# Altium project Main_Board.PrjPcb (part 31 of 44)

## Sheet ST1L08_5V_0V6.SchDoc
size A3
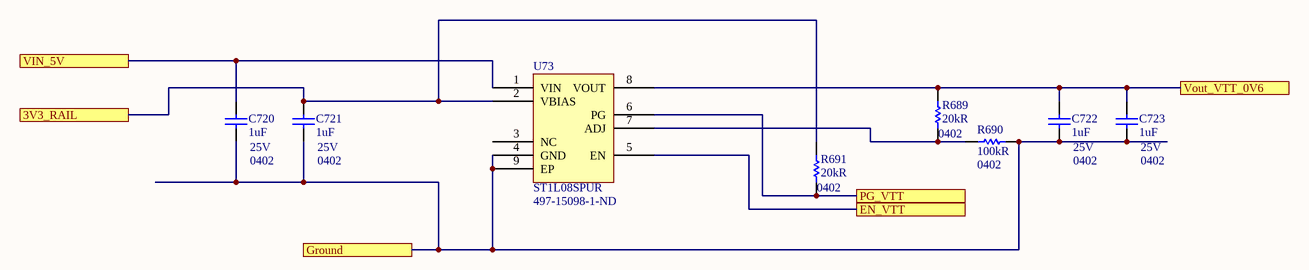
[diagram p44: ST1L08_5V_0V6.SchDoc]

### Parts
C720  1uF  Case/Package: 0402  Voltage Rating: 25V  [CAP 0402/1005 KK]
C721  1uF  Case/Package: 0402  Voltage Rating: 25V  [CAP 0402/1005 KK]
C722  1uF  Case/Package: 0402  Voltage Rating: 25V  [CAP 0402/1005 KK]
C723  1uF  Case/Package: 0402  Voltage Rating: 25V  [CAP 0402/1005 KK]
R689  20kR  Case/Package: 0402  [RES 0402/1005 RF KK]
R690  100kR  Case/Package: 0402  [RES 0402/1005 RF KK]
R691  20kR  Case/Package: 0402  [RES 0402/1005 RF KK]
U73  ST1L08SPUR  Supplier Part Number 1: 497-15098-1-ND  [ST1L08]

### Ports
3V3_RAIL, EN_VTT, Ground, PG_VTT, VIN_5V, Vout_VTT_0V6

### Nets
B503_Ground: C720.1 C721.1 C722.1 C723.1 R690.1 U73.4(GND) U73.9(EP) ; port Ground
3V3_RAIL: C721.2 R691.1 U73.2(VBIAS) ; port 3V3_RAIL
5V_RAIL: C720.2 U73.1(VIN) ; port VIN_5V
GPIOb_02.GPIO4: R691.2 U73.6(PG) ; port PG_VTT
PG2_TPS7A8801_0V9: U73.5(EN) ; port EN_VTT
RAM_DDR4_VTT: C722.2 C723.2 R689.1 U73.8(VOUT) ; port Vout_VTT_0V6
NetR689_2: R689.2 R690.2 U73.7(ADJ)

Not connected (* = marked no-connect by the designer): U73 3(NC)

### Notes on the sheet
- Title
- Size:
- Date:
- A3
- Number:
- Time:
- Revision:
- Sheet
- of
- File:

### Library data of the parts
C720-C723 = Capacitor: as C597 on sheet Power_48_20V@3A; Supplier 1: Digi-Key; Supplier Part Number 1: 490-12263-1-ND; Manufacturer: Murata; Manufacturer Part Number: GRT155R61E105KE01D; RoHS: Yes; Category: Ceramic Capacitors; Stock 1: 341453; Pricing 1: 1=0,18000, 10=0,12300, 100=0,06210, 500=0,04248, 1000=0,03758, 2500=0,03594, 5000=0,03268 (USD); Mount: Surface Mount; Case Code (Metric): 1005; Case Code (Imperial): 0402; Min Operating Temperature: -55°C; Max Operating Temperature: 85°C; Packaging: Tape and Reel; Capacitance: 1uF; Tolerance: 10%; Dielectric: X5R; Voltage Rating (DC): 25V; Length: 0.039inch; Width: 0.02inch; Thickness: 0.022inch; Ratings: AEC-Q200; ComponentLink1URL: http://www.farnell.com/datasheets/2165918.pdf?src-supplier=Farnell; ComponentLink1Description: http://www.farnell.com/datasheets/2165918.pdf?src-supplier=Farnell; ComponentLink2URL: http://search.murata.co.jp/Ceramy/image/img/A01X/G101/ENG/GRT155R61E105KE01-01.pdf?src-supplier=Digi-Key; ComponentLink2Description: http://search.murata.co.jp/Ceramy/image/img/A01X/G101/ENG/GRT155R61E105KE01-01.pdf?src-supplier=Digi-Key; ComponentLink3URL: http://www.farnell.com/datasheets/2165918.pdf?src-supplier=Element14; ComponentLink3Description: http://www.farnell.com/datasheets/2165918.pdf?src-supplier=Element14
R689 R691 = Resistor: as R676 on sheet TPS7A88_3V3_1V8_0V9V@2x1A; Supplier 1: Digi-Key; Supplier Part Number 1: P20.0KLCT-ND; Stock 1: 2516725; Pricing 1: 1 = 0,10000, 10 = 0,05000, 100 = 0,02050, 1000 = 0,00920, 2500 = 0,00798, 5000 = 0,00660 (USD); RoHS: Yes; Mount: Surface Mount; Weight: 2.8E-05oz; Case Code (Metric): 1005; Case Code (Imperial): 0402; Contact Plating: Tin; Min Operating Temperature: -55°C; Max Operating Temperature: 155°C; Resistance: 20kR; Packaging: Cut Tape; Package Quantity: 1; Composition: Thick Film; Number of Terminations: 2; Termination: SMD/SMT; Military Standard: Not; Max Power Dissipation: 100mW; Voltage Rating (DC): 50V; Features: Automotive AEC-Q200; Length: 1mm; Height: 0.35mm; Width: 0.02inch; Depth: 0.5mm; Radiation Hardening: No; REACH SVHC: No SVHC; Lead Free: Lead Free; ComponentLink1URL: https://datasheet.ciiva.com/11821/0900766b80f80784-11821220.pdf?src-supplier=RSComponents; ComponentLink1Description: https://datasheet.ciiva.com/11821/0900766b80f80784-11821220.pdf?src-supplier=RSComponents; ComponentLink2URL: https://datasheet.ciiva.com/16762/70260748-16762885.pdf?src-supplier=Allied+Electronics; ComponentLink2Description: https://datasheet.ciiva.com/16762/70260748-16762885.pdf?src-supplier=Allied+Electronics; ComponentLink3URL: https://datasheet.ciiva.com/16782/70260748-16782455.pdf?src-supplier=Allied+Electronics; ComponentLink3Description: https://datasheet.ciiva.com/16782/70260748-16782455.pdf?src-supplier=Allied+Electronics; ComponentLink4URL: https://datasheet.ciiva.com/48531/aoa0000ce2-48531063.pdf?src-supplier=Avnet; ComponentLink4Description: https://datasheet.ciiva.com/48531/aoa0000ce2-48531063.pdf?src-supplier=Avnet; ComponentLink5URL: https://datasheet.ciiva.com/28688/1678782-28688600.pdf?src-supplier=Element14; ComponentLink5Description: https://datasheet.ciiva.com/28688/1678782-28688600.pdf?src-supplier=Element14; ComponentLink6URL: https://datasheet.ciiva.com/46377/426256-46377368.pdf?src-supplier=Element14; ComponentLink6Description: https://datasheet.ciiva.com/46377/426256-46377368.pdf?src-supplier=Element14; ComponentLink7URL: https://datasheet.ciiva.com/6138/426256-6138761.pdf?src-supplier=Farnell; ComponentLink7Description: https://datasheet.ciiva.com/6138/426256-6138761.pdf?src-supplier=Farnell; ComponentLink8URL: https://datasheet.ciiva.com/24159/aoa0000ce2-24159274.pdf?src-supplier=Mouser; ComponentLink8Description: https://datasheet.ciiva.com/24159/aoa0000ce2-24159274.pdf?src-supplier=Mouser; ComponentLink9URL: https://datasheet.ciiva.com/16508/aoa0000ce2-16508524.pdf?src-supplier=Future+Electronics; ComponentLink9Description: https://datasheet.ciiva.com/16508/aoa0000ce2-16508524.pdf?src-supplier=Future+Electronics; ComponentLink10URL: https://datasheet.ciiva.com/16514/aoa0000ce2-16514269.pdf?src-supplier=Avnet+Asia; ComponentLink10Description: https://datasheet.ciiva.com/16514/aoa0000ce2-16514269.pdf?src-supplier=Avnet+Asia; ComponentLink11URL: https://datasheet.ciiva.com/30049/aoa0000ce2-30049982.pdf?src-supplier=Onlinecomponents.com; ComponentLink11Description: https://datasheet.ciiva.com/30049/aoa0000ce2-30049982.pdf?src-supplier=Onlinecomponents.com
R690 = Resistor: as R646 on sheet ADP1741_3V3_0V85; Supplier 1: Digi-Key; Supplier Part Number 1: P100KDECT-ND; Stock 1: 54338; Pricing 1: 1=0.22000, 10=0.18800, 100=0.07350, 1000=0.03077, 2500=0.02820, 5000=0.02564 (USD); RoHS: Yes; Mount: Surface Mount; Case Code (Imperial): 0402; Case Code (Metric): 1005; Contact Plating: Tin; Min Operating Temperature: -55°C; Max Operating Temperature: 155°C; Resistance: 100kR; Packaging: Tape and Reel; Package Quantity: 10000; Composition: Metal Film,Thin Film; Number of Terminations: 2; Military Standard: Not; Termination: SMD/SMT; Max Power Dissipation: 63mW; Voltage Rating (DC): 25V; Length: 1mm; Height: 0.016inch; Width: 0.5mm; Depth: 0.5mm; Radiation Hardening: No; REACH SVHC: No SVHC; Lead Free: Lead Free; ComponentLink1URL: https://datasheet.ciiva.com/24028/aoa0000ce26-197354-24028150.pdf?src-supplier=Mouser; ComponentLink1Description: https://datasheet.ciiva.com/24028/aoa0000ce26-197354-24028150.pdf?src-supplier=Mouser; ComponentLink2URL: https://datasheet.ciiva.com/43470/1776116-43470438.pdf?src-supplier=Farnell; ComponentLink2Description: https://datasheet.ciiva.com/43470/1776116-43470438.pdf?src-supplier=Farnell; ComponentLink3URL: https://datasheet.ciiva.com/7830/1776116-7830920.pdf?src-supplier=Element14; ComponentLink3Description: https://datasheet.ciiva.com/7830/1776116-7830920.pdf?src-supplier=Element14; ComponentLink4URL: https://datasheet.ciiva.com/46378/1776116-46378234.pdf?src-supplier=Element14; ComponentLink4Description: https://datasheet.ciiva.com/46378/1776116-46378234.pdf?src-supplier=Element14; ComponentLink5URL: https://datasheet.ciiva.com/16780/70068849-16780139.pdf?src-supplier=Allied+Electronics; ComponentLink5Description: https://datasheet.ciiva.com/16780/70068849-16780139.pdf?src-supplier=Allied+Electronics; ComponentLink6URL: https://datasheet.ciiva.com/9117/aoa0000ce26-9117229.pdf?src-supplier=Avnet; ComponentLink6Description: https://datasheet.ciiva.com/9117/aoa0000ce26-9117229.pdf?src-supplier=Avnet; ComponentLink7URL: https://datasheet.ciiva.com/16511/aoa0000ce26-16511566.pdf?src-supplier=Avnet+Asia; ComponentLink7Description: https://datasheet.ciiva.com/16511/aoa0000ce26-16511566.pdf?src-supplier=Avnet+Asia; ComponentLink8URL: https://datasheet.ciiva.com/30225/54aoa0000ce26-30225311.pdf?src-supplier=Onlinecomponents.com; ComponentLink8Description: https://datasheet.ciiva.com/30225/54aoa0000ce26-30225311.pdf?src-supplier=Onlinecomponents.com
U73 = ST1L08SPUR: IC REG LINEAR POS ADJ 800MA 8DFN; Manufacturer: STMicroelectronics; Number of Outputs: 1; Min Input Voltage: 1V; Max Input Voltage: 5.5V; Output Voltage: 4V; Dropout Voltage: 700mV; Polarity: Positive; Accuracy: 2%; Quiescent Current: 150uA; Operating Supply Current: 200nA; Power Supply Rejection Ratio (PSRR): 80dB; Output Type: Adjustable; Supplier 1: Digi-Key; Manufacturer Part Number: ST1L08SPUR; Stock 1: 4850; Pricing 1: 1 = 0,72000, 10 = 0,63200, 25 = 0,59400, 100 = 0,45020, 250 = 0,38316, 500 = 0,36400, 1000 = 0,27779 (USD); RoHS: Yes; Mount: Surface Mount; Case/Package: DFN; Number of Pins: 8; Min Operating Temperature: -40°C; Max Operating Temperature: 125°C; Packaging: Tape and Reel; Max Output Current: 800mA; Output Current: 800mA; Number of Regulators: 1; Input Bias Current: 150uA; Package Quantity: 2500; Tolerance: 2%; Length: 2mm; Height: 0.9mm; Width: 3mm; Radiation Hardening: No; Lead Free: Lead Free; ComponentLink1URL: https://datasheet.ciiva.com/48677/dm00123507-48677501.pdf?src-supplier=Avnet; ComponentLink1Description: https://datasheet.ciiva.com/48677/dm00123507-48677501.pdf?src-supplier=Avnet

## Sheet Power_LED.SchDoc: Power_Led
size A3
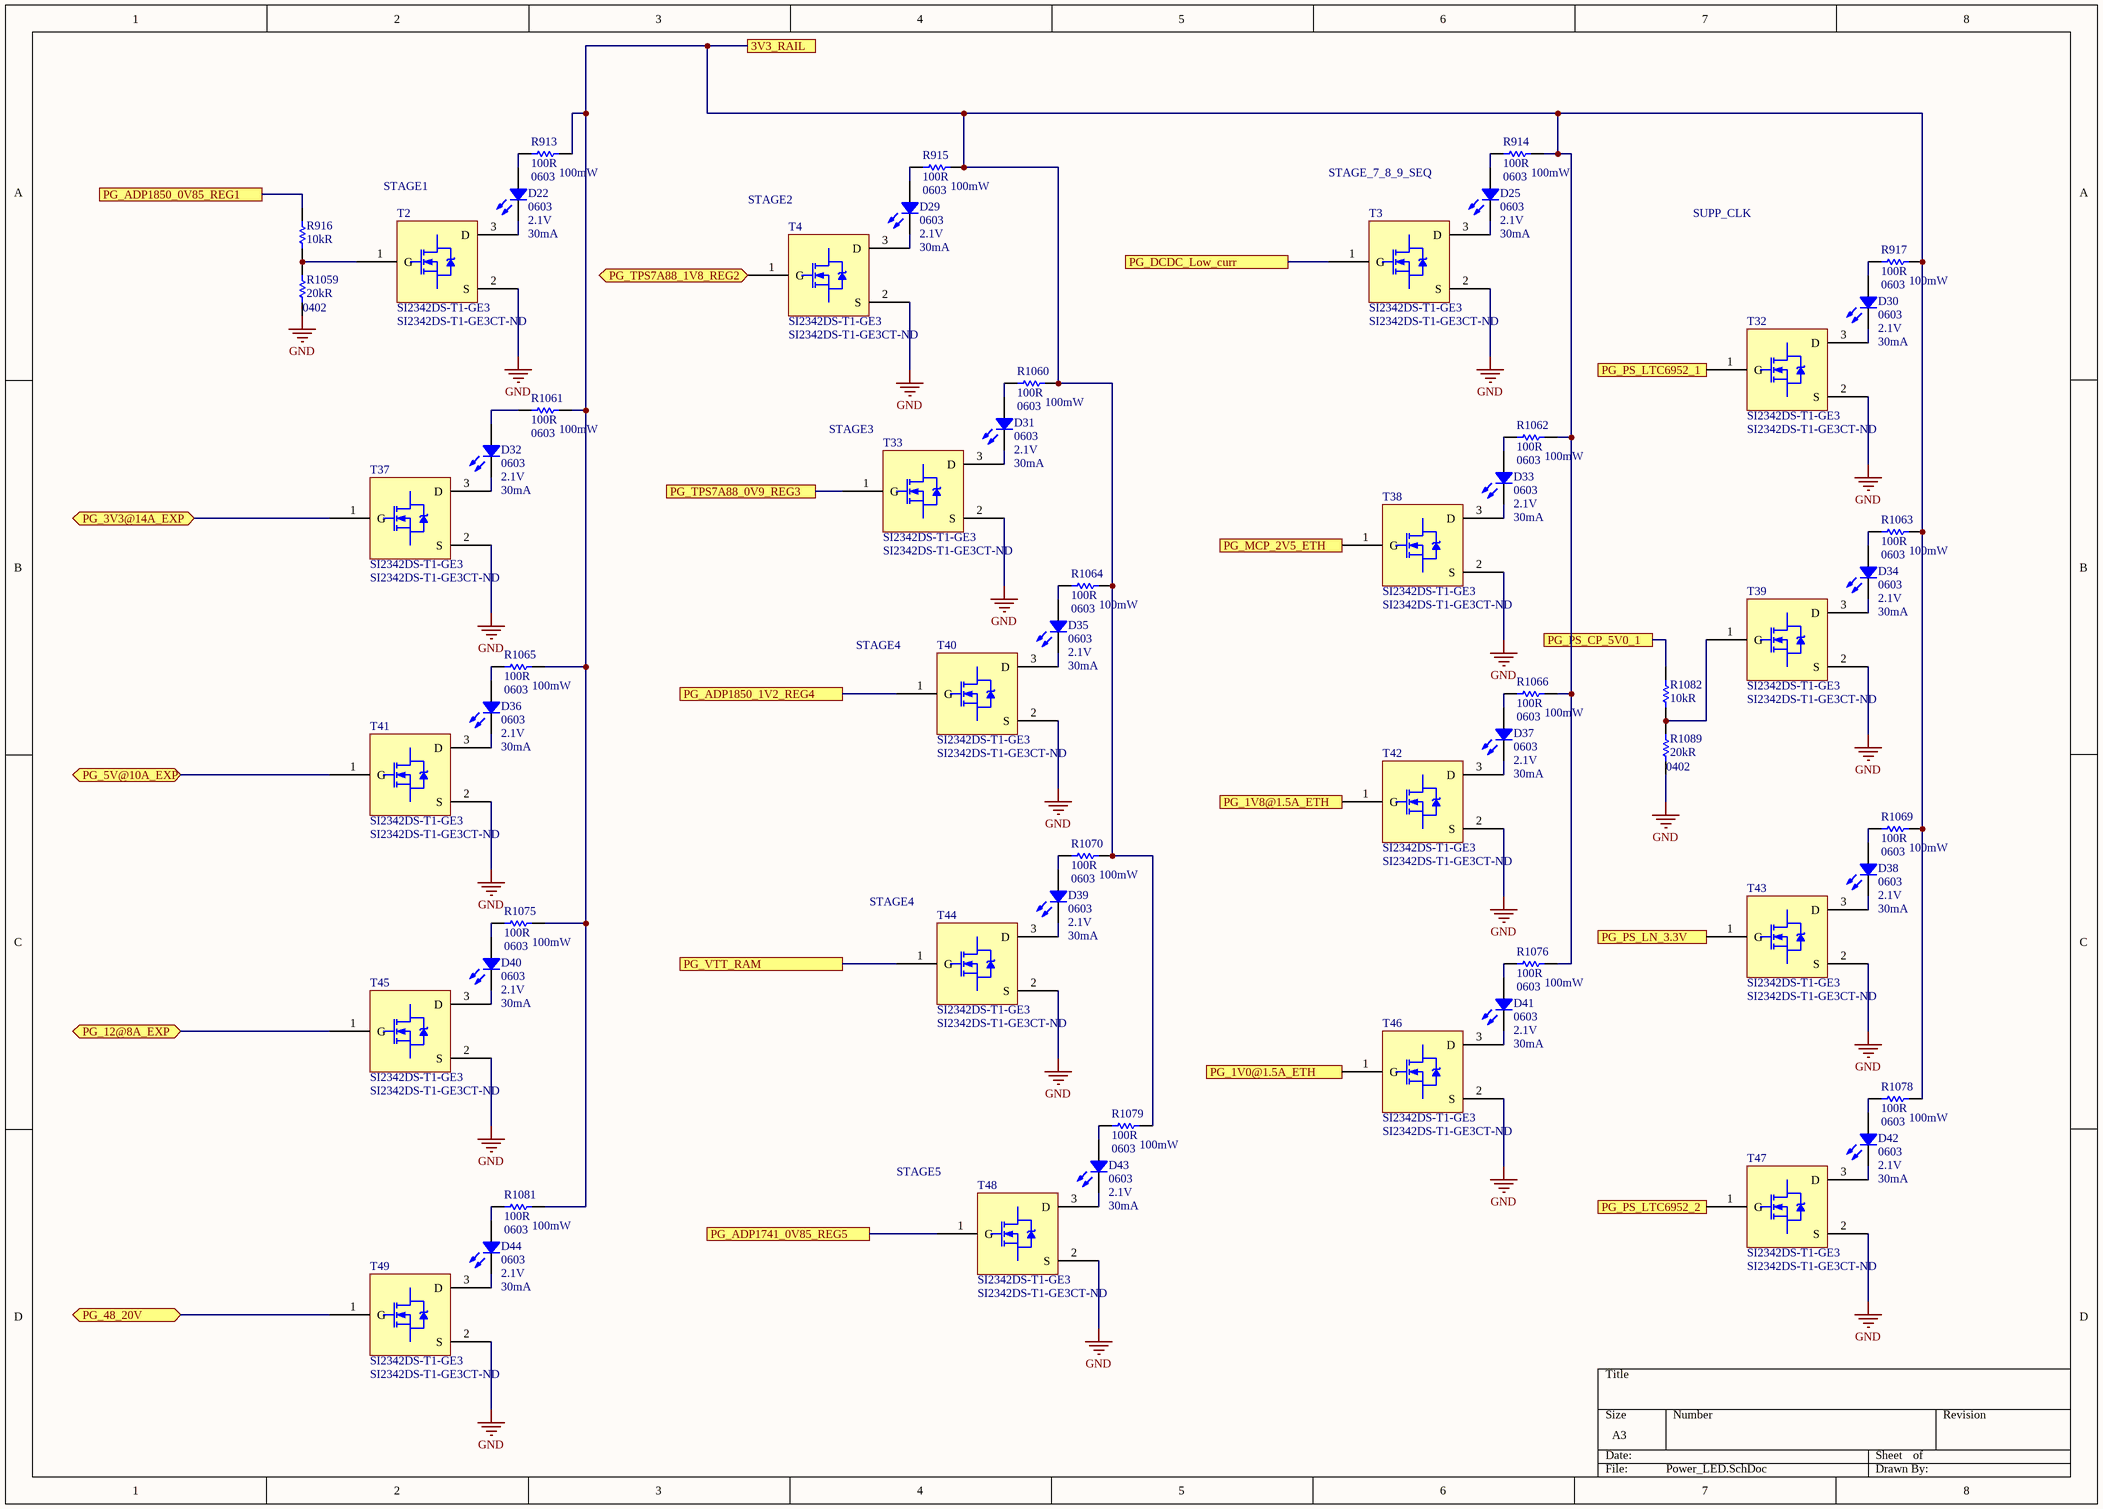
[diagram p45: Power_LED.SchDoc]

### Parts
D22  Case Code (Imperial): 0603  Forward Voltage: 2.1V  Forward Current: 30mA  [LED 0603/1608 GREEN]  (hidden comment: LTST-C190GKT)
D25  Case Code (Imperial): 0603  Forward Voltage: 2.1V  Forward Current: 30mA  [LED 0603/1608 GREEN]  (hidden comment: LTST-C190GKT)
D29  Case Code (Imperial): 0603  Forward Voltage: 2.1V  Forward Current: 30mA  [LED 0603/1608 GREEN]  (hidden comment: LTST-C190GKT)
D30  Case Code (Imperial): 0603  Forward Voltage: 2.1V  Forward Current: 30mA  [LED 0603/1608 GREEN]  (hidden comment: LTST-C190GKT)
D31  Case Code (Imperial): 0603  Forward Voltage: 2.1V  Forward Current: 30mA  [LED 0603/1608 GREEN]  (hidden comment: LTST-C190GKT)
D32  Case Code (Imperial): 0603  Forward Voltage: 2.1V  Forward Current: 30mA  [LED 0603/1608 GREEN]  (hidden comment: LTST-C190GKT)
D33  Case Code (Imperial): 0603  Forward Voltage: 2.1V  Forward Current: 30mA  [LED 0603/1608 GREEN]  (hidden comment: LTST-C190GKT)
D34  Case Code (Imperial): 0603  Forward Voltage: 2.1V  Forward Current: 30mA  [LED 0603/1608 GREEN]  (hidden comment: LTST-C190GKT)
D35  Case Code (Imperial): 0603  Forward Voltage: 2.1V  Forward Current: 30mA  [LED 0603/1608 GREEN]  (hidden comment: LTST-C190GKT)
D36  Case Code (Imperial): 0603  Forward Voltage: 2.1V  Forward Current: 30mA  [LED 0603/1608 GREEN]  (hidden comment: LTST-C190GKT)
D37  Case Code (Imperial): 0603  Forward Voltage: 2.1V  Forward Current: 30mA  [LED 0603/1608 GREEN]  (hidden comment: LTST-C190GKT)
D38  Case Code (Imperial): 0603  Forward Voltage: 2.1V  Forward Current: 30mA  [LED 0603/1608 GREEN]  (hidden comment: LTST-C190GKT)
D39  Case Code (Imperial): 0603  Forward Voltage: 2.1V  Forward Current: 30mA  [LED 0603/1608 GREEN]  (hidden comment: LTST-C190GKT)
D40  Case Code (Imperial): 0603  Forward Voltage: 2.1V  Forward Current: 30mA  [LED 0603/1608 GREEN]  (hidden comment: LTST-C190GKT)
D41  Case Code (Imperial): 0603  Forward Voltage: 2.1V  Forward Current: 30mA  [LED 0603/1608 GREEN]  (hidden comment: LTST-C190GKT)
D42  Case Code (Imperial): 0603  Forward Voltage: 2.1V  Forward Current: 30mA  [LED 0603/1608 GREEN]  (hidden comment: LTST-C190GKT)
D43  Case Code (Imperial): 0603  Forward Voltage: 2.1V  Forward Current: 30mA  [LED 0603/1608 GREEN]  (hidden comment: LTST-C190GKT)
D44  Case Code (Imperial): 0603  Forward Voltage: 2.1V  Forward Current: 30mA  [LED 0603/1608 GREEN]  (hidden comment: LTST-C190GKT)
R913  100R  Case/Package: 0603  Power Rating: 100mW  [RES 0603/1608 RF]
R914  100R  Case/Package: 0603  Power Rating: 100mW  [RES 0603/1608 RF]
R915  100R  Case/Package: 0603  Power Rating: 100mW  [RES 0603/1608 RF]
R916  10kR  [RES 0402/1005 RF KK]
R917  100R  Case/Package: 0603  Power Rating: 100mW  [RES 0603/1608 RF]
R1059  20kR  Case/Package: 0402  [RES 0402/1005 RF KK]
R1060  100R  Case/Package: 0603  Power Rating: 100mW  [RES 0603/1608 RF]
R1061  100R  Case/Package: 0603  Power Rating: 100mW  [RES 0603/1608 RF]
R1062  100R  Case/Package: 0603  Power Rating: 100mW  [RES 0603/1608 RF]
R1063  100R  Case/Package: 0603  Power Rating: 100mW  [RES 0603/1608 RF]
R1064  100R  Case/Package: 0603  Power Rating: 100mW  [RES 0603/1608 RF]
R1065  100R  Case/Package: 0603  Power Rating: 100mW  [RES 0603/1608 RF]
R1066  100R  Case/Package: 0603  Power Rating: 100mW  [RES 0603/1608 RF]
R1069  100R  Case/Package: 0603  Power Rating: 100mW  [RES 0603/1608 RF]
R1070  100R  Case/Package: 0603  Power Rating: 100mW  [RES 0603/1608 RF]
R1075  100R  Case/Package: 0603  Power Rating: 100mW  [RES 0603/1608 RF]
R1076  100R  Case/Package: 0603  Power Rating: 100mW  [RES 0603/1608 RF]
R1078  100R  Case/Package: 0603  Power Rating: 100mW  [RES 0603/1608 RF]
R1079  100R  Case/Package: 0603  Power Rating: 100mW  [RES 0603/1608 RF]
R1081  100R  Case/Package: 0603  Power Rating: 100mW  [RES 0603/1608 RF]
R1082  10kR  [RES 0402/1005 RF KK]
R1089  20kR  Case/Package: 0402  [RES 0402/1005 RF KK]
T2  SI2342DS-T1-GE3  Supplier Part Number 1: SI2342DS-T1-GE3CT-ND  [SI2342DS-T1-GE3]
T3  SI2342DS-T1-GE3  Supplier Part Number 1: SI2342DS-T1-GE3CT-ND  [SI2342DS-T1-GE3]
T4  SI2342DS-T1-GE3  Supplier Part Number 1: SI2342DS-T1-GE3CT-ND  [SI2342DS-T1-GE3]
T32  SI2342DS-T1-GE3  Supplier Part Number 1: SI2342DS-T1-GE3CT-ND  [SI2342DS-T1-GE3]
T33  SI2342DS-T1-GE3  Supplier Part Number 1: SI2342DS-T1-GE3CT-ND  [SI2342DS-T1-GE3]
T37  SI2342DS-T1-GE3  Supplier Part Number 1: SI2342DS-T1-GE3CT-ND  [SI2342DS-T1-GE3]
T38  SI2342DS-T1-GE3  Supplier Part Number 1: SI2342DS-T1-GE3CT-ND  [SI2342DS-T1-GE3]
T39  SI2342DS-T1-GE3  Supplier Part Number 1: SI2342DS-T1-GE3CT-ND  [SI2342DS-T1-GE3]
T40  SI2342DS-T1-GE3  Supplier Part Number 1: SI2342DS-T1-GE3CT-ND  [SI2342DS-T1-GE3]
T41  SI2342DS-T1-GE3  Supplier Part Number 1: SI2342DS-T1-GE3CT-ND  [SI2342DS-T1-GE3]
T42  SI2342DS-T1-GE3  Supplier Part Number 1: SI2342DS-T1-GE3CT-ND  [SI2342DS-T1-GE3]
T43  SI2342DS-T1-GE3  Supplier Part Number 1: SI2342DS-T1-GE3CT-ND  [SI2342DS-T1-GE3]
T44  SI2342DS-T1-GE3  Supplier Part Number 1: SI2342DS-T1-GE3CT-ND  [SI2342DS-T1-GE3]
T45  SI2342DS-T1-GE3  Supplier Part Number 1: SI2342DS-T1-GE3CT-ND  [SI2342DS-T1-GE3]
T46  SI2342DS-T1-GE3  Supplier Part Number 1: SI2342DS-T1-GE3CT-ND  [SI2342DS-T1-GE3]
T47  SI2342DS-T1-GE3  Supplier Part Number 1: SI2342DS-T1-GE3CT-ND  [SI2342DS-T1-GE3]
T48  SI2342DS-T1-GE3  Supplier Part Number 1: SI2342DS-T1-GE3CT-ND  [SI2342DS-T1-GE3]
T49  SI2342DS-T1-GE3  Supplier Part Number 1: SI2342DS-T1-GE3CT-ND  [SI2342DS-T1-GE3]

### Ports
3V3_RAIL, PG_1V0@1.5A_ETH, PG_1V8@1.5A_ETH, PG_3V3@14A_EXP (bidir), PG_5V@10A_EXP (bidir), PG_12@8A_EXP (bidir), PG_48_20V (bidir), PG_ADP1741_0V85_REG5, PG_ADP1850_0V85_REG1, PG_ADP1850_1V2_REG4, PG_DCDC_Low_curr, PG_MCP_2V5_ETH, PG_PS_CP_5V0_1, PG_PS_LN_3.3V, PG_PS_LTC6952_1, PG_PS_LTC6952_2, PG_TPS7A88_0V9_REG3, PG_TPS7A88_1V8_REG2 (bidir), PG_VTT_RAM

### Nets
GND: R1059.2 R1089.2 T2.2(S) T3.2(S) T4.2(S) T32.2(S) T33.2(S) T37.2(S) T38.2(S) T39.2(S) T40.2(S) T41.2(S) T42.2(S) T43.2(S) T44.2(S) T45.2(S) T46.2(S) T47.2(S) T48.2(S) T49.2(S)  [project net B503_Ground]
3V3_RAIL: R913.2 R914.2 R915.2 R917.2 R1060.2 R1061.2 R1062.2 R1063.2 R1064.2 R1065.2 R1066.2 R1069.2 R1070.2 R1075.2 R1076.2 R1078.2 R1079.2 R1081.2 ; port 3V3_RAIL
ADP1741_PG: T43.1(G) ; port PG_PS_LN_3.3V
EN1_TPS: R916.1 ; port PG_ADP1850_0V85_REG1
EN2_TPS: T4.1(G) ; port PG_TPS7A88_1V8_REG2
EN_SEQ_LT3504: T48.1(G) ; port PG_ADP1741_0V85_REG5
GPIOa_00.GPIO5: T46.1(G) ; port PG_1V0@1.5A_ETH
GPIOa_00.GPIO6: T42.1(G) ; port PG_1V8@1.5A_ETH
GPIOb_02.GPIO4: T44.1(G) ; port PG_VTT_RAM
GPIOb_12.GPIO7: T3.1(G) ; port PG_DCDC_Low_curr
PG2_TPS7A8801_0V9: T33.1(G) ; port PG_TPS7A88_0V9_REG3
PG_2V5@1.5A: T38.1(G) ; port PG_MCP_2V5_ETH
PG_3V3@14A_EXP: T37.1(G) ; port PG_3V3@14A_EXP
PG_5V@10A_EXP: T41.1(G) ; port PG_5V@10A_EXP
PG_12@8A_EXP: T45.1(G) ; port PG_12@8A_EXP
PG_48_20V: T49.1(G) ; port PG_48_20V
PG_ADP1850_1V2_REG4: T40.1(G) ; port PG_ADP1850_1V2_REG4
PG_LT3042: R1082.1 ; port PG_PS_CP_5V0_1
PG_PS_LTC6952_1: T32.1(G) ; port PG_PS_LTC6952_1
PG_PS_LTC6952_2: T47.1(G) ; port PG_PS_LTC6952_2
NetD22_1: D22.1 R913.1
NetD22_2: D22.2 T2.3(D)
NetD25_1: D25.1 R914.1
NetD25_2: D25.2 T3.3(D)
NetD29_1: D29.1 R915.1
NetD29_2: D29.2 T4.3(D)
NetD30_1: D30.1 R917.1
NetD30_2: D30.2 T32.3(D)
NetD31_1: D31.1 R1060.1
NetD31_2: D31.2 T33.3(D)
NetD32_1: D32.1 R1061.1
NetD32_2: D32.2 T37.3(D)
NetD33_1: D33.1 R1062.1
NetD33_2: D33.2 T38.3(D)
NetD34_1: D34.1 R1063.1
NetD34_2: D34.2 T39.3(D)
NetD35_1: D35.1 R1064.1
NetD35_2: D35.2 T40.3(D)
NetD36_1: D36.1 R1065.1
NetD36_2: D36.2 T41.3(D)
NetD37_1: D37.1 R1066.1
NetD37_2: D37.2 T42.3(D)
NetD38_1: D38.1 R1069.1
NetD38_2: D38.2 T43.3(D)
NetD39_1: D39.1 R1070.1
NetD39_2: D39.2 T44.3(D)
NetD40_1: D40.1 R1075.1
NetD40_2: D40.2 T45.3(D)
NetD41_1: D41.1 R1076.1
NetD41_2: D41.2 T46.3(D)
NetD42_1: D42.1 R1078.1
NetD42_2: D42.2 T47.3(D)
NetD43_1: D43.1 R1079.1
NetD43_2: D43.2 T48.3(D)
NetD44_1: D44.1 R1081.1
NetD44_2: D44.2 T49.3(D)
NetR916_2: R916.2 R1059.1 T2.1(G)
NetR1082_2: R1082.2 R1089.1 T39.1(G)

### Notes on the sheet
- STAGE_7_8_9_SEQ
- (near T2) STAGE1
- (near T4) STAGE2
- SUPP_CLK
- (near T33) STAGE3
- (near T40) STAGE4
- (near T44) STAGE4
- (near T48) STAGE5

### Library data of the parts
D22 D25 D29-D44 = LTST-C190GKT: LED,  LTST-C190GKT; Manufacturer 1: Vishay Lite-On; Color: Green; Lens Color: Colorless; Luminous Intensity: 6mcd; Viewing Angle: 130°; Lens Style: Clear,Diffused,Colorless,Rectangular; Power Rating: 100mW; Dominant Wavelength: 569nm; Test Current: 10mA; Lens Transparency: Clear; Number of Elements: 1; Wavelength: 565nm; Voltage: 2V; Reverse Voltage: 5V; Supplier 1: Digi-Key; Manufacturer Part Number 1: LTST-C190GKT; Stock 1: 908158; Pricing 1: 1=0.26000, 10=0.18800, 100=0.08880, 500=0.05922, 1000=0.04639 (USD); RoHS: Yes; Mount: Surface Mount; Case/Package: 0603; Number of Pins: 2; Case Code (Metric): 1608; Min Operating Temperature: -55°C; Max Operating Temperature: 85°C; Package Quantity: 1; Packaging: Tape and Reel; Illumination Color: Green; Power Dissipation: 100mW; Number of LEDs: 1; Length: 1.6mm; Height: 0.8mm; Width: 0.8mm; Depth: 0.8mm; Radiation Hardening: No; Lead Free: Lead Free; ComponentLink1URL: https://datasheet.ciiva.com/11775/0900766b80dc02a6-11775616.pdf?src-supplier=RSComponents; ComponentLink1Description: https://datasheet.ciiva.com/11775/0900766b80dc02a6-11775616.pdf?src-supplier=RSComponents; ComponentLink2URL: https://datasheet.ciiva.com/2109/ltst-c190gkt-2109985.pdf?src-supplier=Digi-Key; ComponentLink2Description: https://datasheet.ciiva.com/2109/ltst-c190gkt-2109985.pdf?src-supplier=Digi-Key; ComponentLink3URL: https://datasheet.ciiva.com/16392/lite-on20ltst-c190gkt-16392818.pdf?src-supplier=Future+Electronics; ComponentLink3Description: https://datasheet.ciiva.com/16392/lite-on20ltst-c190gkt-16392818.pdf?src-supplier=Future+Electronics; ComponentLink4URL: https://datasheet.ciiva.com/12403/lite-on-ltst-c190gkt-187204-12403884.pdf?src-supplier=Mouser; ComponentLink4Description: https://datasheet.ciiva.com/12403/lite-on-ltst-c190gkt-187204-12403884.pdf?src-supplier=Mouser; ComponentLink5URL: https://datasheet.ciiva.com/2109/ltst-c190gkt-2109986.pdf?src-supplier=Digi-Key; ComponentLink5Description: https://datasheet.ciiva.com/2109/ltst-c190gkt-2109986.pdf?src-supplier=Digi-Key; ComponentLink6URL: https://datasheet.ciiva.com/2109/ltst-c190gkt-2109987.pdf?src-supplier=Digi-Key; ComponentLink6Description: https://datasheet.ciiva.com/2109/ltst-c190gkt-2109987.pdf?src-supplier=Digi-Key; Supplier Part Number 1: 160-1183-1-ND
R913-R915 R917 R1060-R1066 R1069 R1070 R1075 R1076 R1078 R1079 R1081 = Resistor: KOA SPEAR ELECTRONICS - RK73H1JTTD1000F - RES, 100R, 1%, 0.1W, 0603, THICK FILM; Manufacturer: KOA Speer; Voltage Rating: 50V; Temperature Coefficient: 100ppm/°C; Supplier 1: Digi-Key; Supplier Part Number 1: 2019-RK73H1JTTD1000FCT-ND; Manufacturer Part Number: RK73H1JTTD1000F; RoHS: Yes; Category: Chip SMD Resistors; Stock 1: 1297624; Pricing 1: 1=0,10000, 10=0,02200, 100=0,00910, 1000=0,00408, 2500=0,00354 (USD); Number of Pins: 2; Case Code (Imperial): 0603; Case Code (Metric): 1608; Min Operating Temperature: -55°C; Max Operating Temperature: 155°C; Resistance: 100R; Tolerance: 1%; Packaging: Tape and Reel; Package Quantity: 5000; Composition: Thick Film; Termination: SMD/SMT; Military Standard: Not; Voltage Rating (DC): 50V; Length: 1.6mm; Height: 0.45mm; Width: 0.8mm; Depth: 0.8mm; REACH SVHC: Unknown; Lead Free: Lead Free; ComponentLink1URL: https://datasheet.ciiva.com/48426/rk73h-series-eng-jap-tds-48426518.pdf?src-supplier=Distrelec; ComponentLink1Description: https://datasheet.ciiva.com/48426/rk73h-series-eng-jap-tds-48426518.pdf?src-supplier=Distrelec; ComponentLink2URL: https://datasheet.ciiva.com/7773/549017-7773367.pdf?src-supplier=Element14; ComponentLink2Description: https://datasheet.ciiva.com/7773/549017-7773367.pdf?src-supplier=Element14; ComponentLink3URL: https://datasheet.ciiva.com/5556/rk73h-5556218.pdf?src-supplier=Mouser; ComponentLink3Description: https://datasheet.ciiva.com/5556/rk73h-5556218.pdf?src-supplier=Mouser
R916 R1082 = Resistor: Manufacturer 1: Yageo; Manufacturer Part Number 1: RC0402FR-0710KL; Tolerance: 1%; Temperature Coefficient: 100ppm/°C; Voltage Rating: 50V; Power Rating: 62.5mW; Supplier 1: Digi-Key; Supplier Part Number 1: 311-10.0KLRCT-ND; Stock 1: 71214322; Pricing 1: 1=0,10000, 10=0,01500, 100=0,00600, 1000=0,00270, 2500=0,00235, 5000=0,00194 (USD); RoHS: Yes; Case/Package: 0402; Number of Pins: 2; Case Code (Imperial): 0402; Case Code (Metric): 1005; Min Operating Temperature: -55°C; Max Operating Temperature: 155°C; Resistance: 10kR; Packaging: Tape and Reel; Composition: Thick Film; Voltage Rating (DC): 50V; Termination: SMD/SMT; Military Standard: Not; Working Voltage: 50V; Number of Terminations: 2; Length: 1mm; Height: 0.32mm; Width: 0.5mm; Depth: 0.5mm; Lead Pitch: 0.2mm; REACH SVHC: No SVHC; Lead Free: Lead Free; ComponentLink1URL: https://datasheet.ciiva.com/7660/38568-7660787.pdf?src-supplier=Element14; ComponentLink1Description: https://datasheet.ciiva.com/7660/38568-7660787.pdf?src-supplier=Element14; ComponentLink2URL: https://datasheet.ciiva.com/7849/1784430-7849813.pdf?src-supplier=Element14; ComponentLink2Description: https://datasheet.ciiva.com/7849/1784430-7849813.pdf?src-supplier=Element14; ComponentLink3URL: https://datasheet.ciiva.com/7849/1686128-7849814.pdf?src-supplier=Element14; ComponentLink3Description: https://datasheet.ciiva.com/7849/1686128-7849814.pdf?src-supplier=Element14; ComponentLink4URL: https://datasheet.ciiva.com/7849/1784430-7849815.pdf?src-supplier=Element14; ComponentLink4Description: https://datasheet.ciiva.com/7849/1784430-7849815.pdf?src-supplier=Element14; ComponentLink5URL: https://datasheet.ciiva.com/22747/1018594-22747512.pdf?src-supplier=Element14; ComponentLink5Description: https://datasheet.ciiva.com/22747/1018594-22747512.pdf?src-supplier=Element14; ComponentLink6URL: https://datasheet.ciiva.com/12667/pyu-rc0402-51-rohs-l-6-r-12667067.pdf?src-supplier=Mouser; ComponentLink6Description: https://datasheet.ciiva.com/12667/pyu-rc0402-51-rohs-l-6-r-12667067.pdf?src-supplier=Mouser; ComponentLink7URL: https://datasheet.ciiva.com/7983/1018594-7983486.pdf?src-supplier=Element14; ComponentLink7Description: https://datasheet.ciiva.com/7983/1018594-7983486.pdf?src-supplier=Element14
R1059 R1089 = Resistor: as R676 on sheet TPS7A88_3V3_1V8_0V9V@2x1A; Supplier 1: Digi-Key; Supplier Part Number 1: P20.0KLCT-ND; Stock 1: 2516725; Pricing 1: 1 = 0,10000, 10 = 0,05000, 100 = 0,02050, 1000 = 0,00920, 2500 = 0,00798, 5000 = 0,00660 (USD); RoHS: Yes; Mount: Surface Mount; Weight: 2.8E-05oz; Case Code (Metric): 1005; Case Code (Imperial): 0402; Contact Plating: Tin; Min Operating Temperature: -55°C; Max Operating Temperature: 155°C; Resistance: 20kR; Packaging: Cut Tape; Package Quantity: 1; Composition: Thick Film; Number of Terminations: 2; Termination: SMD/SMT; Military Standard: Not; Max Power Dissipation: 100mW; Voltage Rating (DC): 50V; Features: Automotive AEC-Q200; Length: 1mm; Height: 0.35mm; Width: 0.02inch; Depth: 0.5mm; Radiation Hardening: No; REACH SVHC: No SVHC; Lead Free: Lead Free; ComponentLink1URL: https://datasheet.ciiva.com/11821/0900766b80f80784-11821220.pdf?src-supplier=RSComponents; ComponentLink1Description: https://datasheet.ciiva.com/11821/0900766b80f80784-11821220.pdf?src-supplier=RSComponents; ComponentLink2URL: https://datasheet.ciiva.com/16762/70260748-16762885.pdf?src-supplier=Allied+Electronics; ComponentLink2Description: https://datasheet.ciiva.com/16762/70260748-16762885.pdf?src-supplier=Allied+Electronics; ComponentLink3URL: https://datasheet.ciiva.com/16782/70260748-16782455.pdf?src-supplier=Allied+Electronics; ComponentLink3Description: https://datasheet.ciiva.com/16782/70260748-16782455.pdf?src-supplier=Allied+Electronics; ComponentLink4URL: https://datasheet.ciiva.com/48531/aoa0000ce2-48531063.pdf?src-supplier=Avnet; ComponentLink4Description: https://datasheet.ciiva.com/48531/aoa0000ce2-48531063.pdf?src-supplier=Avnet; ComponentLink5URL: https://datasheet.ciiva.com/28688/1678782-28688600.pdf?src-supplier=Element14; ComponentLink5Description: https://datasheet.ciiva.com/28688/1678782-28688600.pdf?src-supplier=Element14; ComponentLink6URL: https://datasheet.ciiva.com/46377/426256-46377368.pdf?src-supplier=Element14; ComponentLink6Description: https://datasheet.ciiva.com/46377/426256-46377368.pdf?src-supplier=Element14; ComponentLink7URL: https://datasheet.ciiva.com/6138/426256-6138761.pdf?src-supplier=Farnell; ComponentLink7Description: https://datasheet.ciiva.com/6138/426256-6138761.pdf?src-supplier=Farnell; ComponentLink8URL: https://datasheet.ciiva.com/24159/aoa0000ce2-24159274.pdf?src-supplier=Mouser; ComponentLink8Description: https://datasheet.ciiva.com/24159/aoa0000ce2-24159274.pdf?src-supplier=Mouser; ComponentLink9URL: https://datasheet.ciiva.com/16508/aoa0000ce2-16508524.pdf?src-supplier=Future+Electronics; ComponentLink9Description: https://datasheet.ciiva.com/16508/aoa0000ce2-16508524.pdf?src-supplier=Future+Electronics; ComponentLink10URL: https://datasheet.ciiva.com/16514/aoa0000ce2-16514269.pdf?src-supplier=Avnet+Asia; ComponentLink10Description: https://datasheet.ciiva.com/16514/aoa0000ce2-16514269.pdf?src-supplier=Avnet+Asia; ComponentLink11URL: https://datasheet.ciiva.com/30049/aoa0000ce2-30049982.pdf?src-supplier=Onlinecomponents.com; ComponentLink11Description: https://datasheet.ciiva.com/30049/aoa0000ce2-30049982.pdf?src-supplier=Onlinecomponents.com
T2-T4 T32 T33 T37-T49 = SI2342DS-T1-GE3: Trans MOSFET N-CH 8V 6A 3-Pin SOT-23 T/R; Manufacturer: Vishay; Rds On Max: 17mR; Input Capacitance: 1.07nF; Rise Time: 14ns; Max Power Dissipation: 2.5W; Number of Elements: 1; Power Dissipation: 1.3W; Turn-On Delay Time: 6ns; Turn-Off Delay Time: 65ns; Fall Time: 25ns; Threshold Voltage: 800mV; Gate to Source Voltage (Vgs): 5V; Supplier 1: Digi-Key; Manufacturer Part Number: SI2342DS-T1-GE3; RoHS: Yes; Category: MOSFETs; Stock 1: 25972; Pricing 1: 1=0,50000, 10=0,42500, 25=0,39640, 100=0,29460, 250=0,27984, 500=0,23000, 1000=0,18695 (USD); Mount: Surface Mount; Case/Package: SOT-23; Number of Pins: 3; Contact Plating: Tin,Matte; Min Operating Temperature: -55°C; Max Operating Temperature: 150°C; Packaging: Tape and Reel; Package Quantity: 3000; Drain to Source Voltage (Vdss): 8V; Continuous Drain Current (ID): 6A; Radiation Hardening: No; REACH SVHC: No SVHC; Lead Free: Lead Free; ComponentLink1URL: https://datasheet.ciiva.com/14905/si2342ds-14905257.pdf?src-supplier=Arrow; ComponentLink1Description: https://datasheet.ciiva.com/14905/si2342ds-14905257.pdf?src-supplier=Arrow; ComponentLink2URL: https://datasheet.ciiva.com/29746/si2342ds-29746581.pdf?src-supplier=Digi-Key; ComponentLink2Description: https://datasheet.ciiva.com/29746/si2342ds-29746581.pdf?src-supplier=Digi-Key; ComponentLink3URL: https://datasheet.ciiva.com/30021/si2342ds-30021814.pdf?src-supplier=Avnet; ComponentLink3Description: https://datasheet.ciiva.com/30021/si2342ds-30021814.pdf?src-supplier=Avnet

## Sheet Translator_I2C.SchDoc
size A3
Used 4 times, as channels Trans_LS_I2C0, Trans_PS_I2C0, Trans_PS_I2C1, Trans_LS_I2C1. Parts and nets are listed once, with the designators drawn on the sheet.
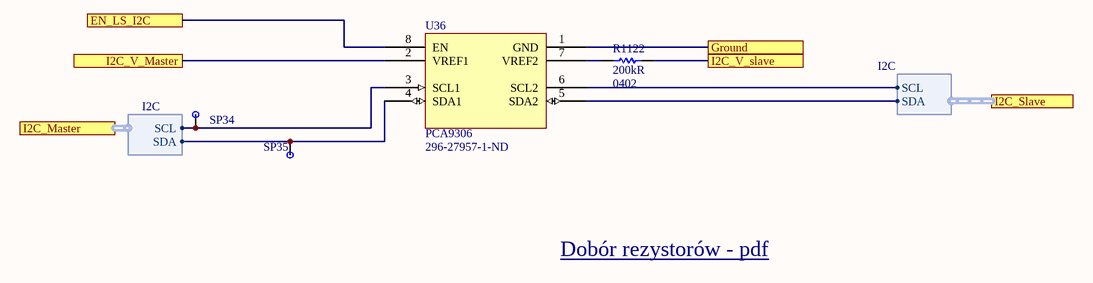
[diagram p46: Translator_I2C.SchDoc]

### Parts
R1122  200kR  Case/Package: 0402  [RES 0402/1005 RF KK]
SP34  SP  [MeasureTP]  (value not drawn)
SP35  SP  [MeasureTP]  (value not drawn)
U36  PCA9306  Supplier Part Number 1: 296-27957-1-ND  [PCA9306]

### Ports
EN_LS_I2C, Ground, I2C_Master (harness I2C), I2C_Slave (harness I2C), I2C_V_Master, I2C_V_slave

### Harnesses
I2C: SDA, SCL
I2C: SCL, SDA

### Nets
EN_LS_I2C: U36.8(EN) ; port EN_LS_I2C
Ground: U36.1(GND) ; port Ground
I2C_V_Master: U36.2(VREF1) ; port I2C_V_Master
I2C_V_slave: R1122.1 ; port I2C_V_slave
NetR1122_2: R1122.2 U36.7(VREF2)
NetSP34_1: SP34.1 U36.3(SCL1) ; port I2C_Master.SCL
NetSP35_1: SP35.1 U36.4(SDA1) ; port I2C_Master.SDA
NetU36_5: U36.5(SDA2) ; port I2C_Slave.SDA
NetU36_6: U36.6(SCL2) ; port I2C_Slave.SCL

### Channels
Trans_LS_I2C0: designators end in _Trans_LS_I2C0; ports EN_LS_I2C=NetR918_2 Ground=B503_Ground I2C_V_Master=US+_MGTVccAux I2C_V_slave=3V3_RAIL
Trans_PS_I2C0: designators end in _Trans_PS_I2C0; ports EN_LS_I2C=MIO_GPIO_2_75 Ground=B503_Ground I2C_V_Master=3V3_RAIL I2C_V_slave=3V3_RAIL
Trans_PS_I2C1: designators end in _Trans_PS_I2C1; ports EN_LS_I2C=MIO_GPIO_2_74 Ground=B503_Ground I2C_V_Master=ETH_VDDIO I2C_V_slave=3V3_RAIL
Trans_LS_I2C1: designators end in _Trans_LS_I2C1; ports EN_LS_I2C=NetR919_2 Ground=B503_Ground I2C_V_Master=US+_MGTVccAux I2C_V_slave=3V3_RAIL

### Notes on the sheet
- Dobór rezystorów - pdf <http://www.ti.com/lit/an/slva689/slva689.pdf>
- Title
- Size:
- Date:
- A3
- Number:
- Time:
- Revision:
- Sheet
- of
- File:

### Library data of the parts
R1122 = Resistor: Manufacturer: Vishay BCcomponents; Manufacturer Part Number: MCS04020C2003FE000; Tolerance: 1%; Temperature Coefficient: 50ppm/°C; Supplier 1: Digi-Key; Supplier Part Number 1: 749-1562-1-ND; Stock 1: 19500; Pricing 1: 1 = 0,29000, 10 = 0,24200, 100 = 0,09460, 1000 = 0,03960, 2500 = 0,03630, 5000 = 0,03300 (USD); RoHS: Yes; Contact Plating: Tin; Min Operating Temperature: -55°C; Max Operating Temperature: 125°C; Resistance: 200kR; Packaging: Tape and Reel; Composition: Thin Film; Military Standard: Not; Length: 1mm; Depth: 0.5mm; Width: 500um; Radiation Hardening: No; Lead Free: Lead Free; ComponentLink1URL: https://datasheet.ciiva.com/8899/mc-pro-8899257.pdf?src-supplier=Avnet; ComponentLink1Description: https://datasheet.ciiva.com/8899/mc-pro-8899257.pdf?src-supplier=Avnet; ComponentLink2URL: https://datasheet.ciiva.com/17167/mc-pro-17167599.pdf?src-supplier=Avnet+Europe; ComponentLink2Description: https://datasheet.ciiva.com/17167/mc-pro-17167599.pdf?src-supplier=Avnet+Europe
U36 = PCA9306: I2C [V] Level translator; Manufacturer: Texas Instruments; Manufacturer Part Number: PCA9306DQER; Max Supply Voltage: 5V; Min Supply Voltage: 0uV; Propagation Delay: 0.3ns; Number of Channels: 2; Turn-On Delay Time: 1.4ns; Low Level Output Current: 128mA; Supplier 1: Digi-Key; Stock 1: 43494; Pricing 1: 1 = 0,67000, 10 = 0,59100, 100 = 0,45340, 500 = 0,35844, 1000 = 0,28675 (USD); RoHS: Yes; Number of Pins: 8; Min Operating Temperature: -40°C; Max Operating Temperature: 85°C; Package Quantity: 1; Packaging: Tape and Reel; Logic Function: Translator; Number of Bits: 2; Output Type: I2C; Number of Outputs: 2; Length: 1.45mm; Height: 0.35mm; Width: 1.05mm; Radiation Hardening: No; Lead Free: Lead Free; REACH SVHC: No SVHC; ComponentLink1URL: https://datasheet.ciiva.com/1899/pca9306-1899328.pdf?src-supplier=Digi-Key; ComponentLink1Description: https://datasheet.ciiva.com/1899/pca9306-1899328.pdf?src-supplier=Digi-Key; ComponentLink2URL: https://datasheet.ciiva.com/22631/1719693-22631024.pdf?src-supplier=Element14; ComponentLink2Description: https://datasheet.ciiva.com/22631/1719693-22631024.pdf?src-supplier=Element14; ComponentLink3URL: https://datasheet.ciiva.com/15095/getdatasheetpartid-306496-15095555.pdf?src-supplier=Verical; ComponentLink3Description: https://datasheet.ciiva.com/15095/getdatasheetpartid-306496-15095555.pdf?src-supplier=Verical; ComponentLink4URL: https://datasheet.ciiva.com/1504/1862428-1504149.pdf?src-supplier=Element14; ComponentLink4Description: https://datasheet.ciiva.com/1504/1862428-1504149.pdf?src-supplier=Element14; ComponentLink5URL: https://datasheet.ciiva.com/26041/pca9306-26041014.pdf?src-supplier=Avnet+Europe; ComponentLink5Description: https://datasheet.ciiva.com/26041/pca9306-26041014.pdf?src-supplier=Avnet+Europe; ComponentLink6URL: https://datasheet.ciiva.com/14287/pca9306-14287374.pdf?src-supplier=Avnet; ComponentLink6Description: https://datasheet.ciiva.com/14287/pca9306-14287374.pdf?src-supplier=Avnet; ComponentLink7URL: https://datasheet.ciiva.com/1899/pca9306-1899326.pdf?src-supplier=Digi-Key; ComponentLink7Description: https://datasheet.ciiva.com/1899/pca9306-1899326.pdf?src-supplier=Digi-Key; ComponentLink8URL: https://datasheet.ciiva.com/14287/pca9306-14287470.pdf?src-supplier=Avnet; ComponentLink8Description: https://datasheet.ciiva.com/14287/pca9306-14287470.pdf?src-supplier=Avnet; ComponentLink9URL: https://datasheet.ciiva.com/1899/pca9306-1899327.pdf?src-supplier=Digi-Key; ComponentLink9Description: https://datasheet.ciiva.com/1899/pca9306-1899327.pdf?src-supplier=Digi-Key